# Altium schematic sheet CW341_FPGA_DECOUP.SchDoc: FPGA Decoupling
size Letter; SheetNumber: 2; SheetTotal: 16; SheetApproved: YES; Application_BuildNumber: .
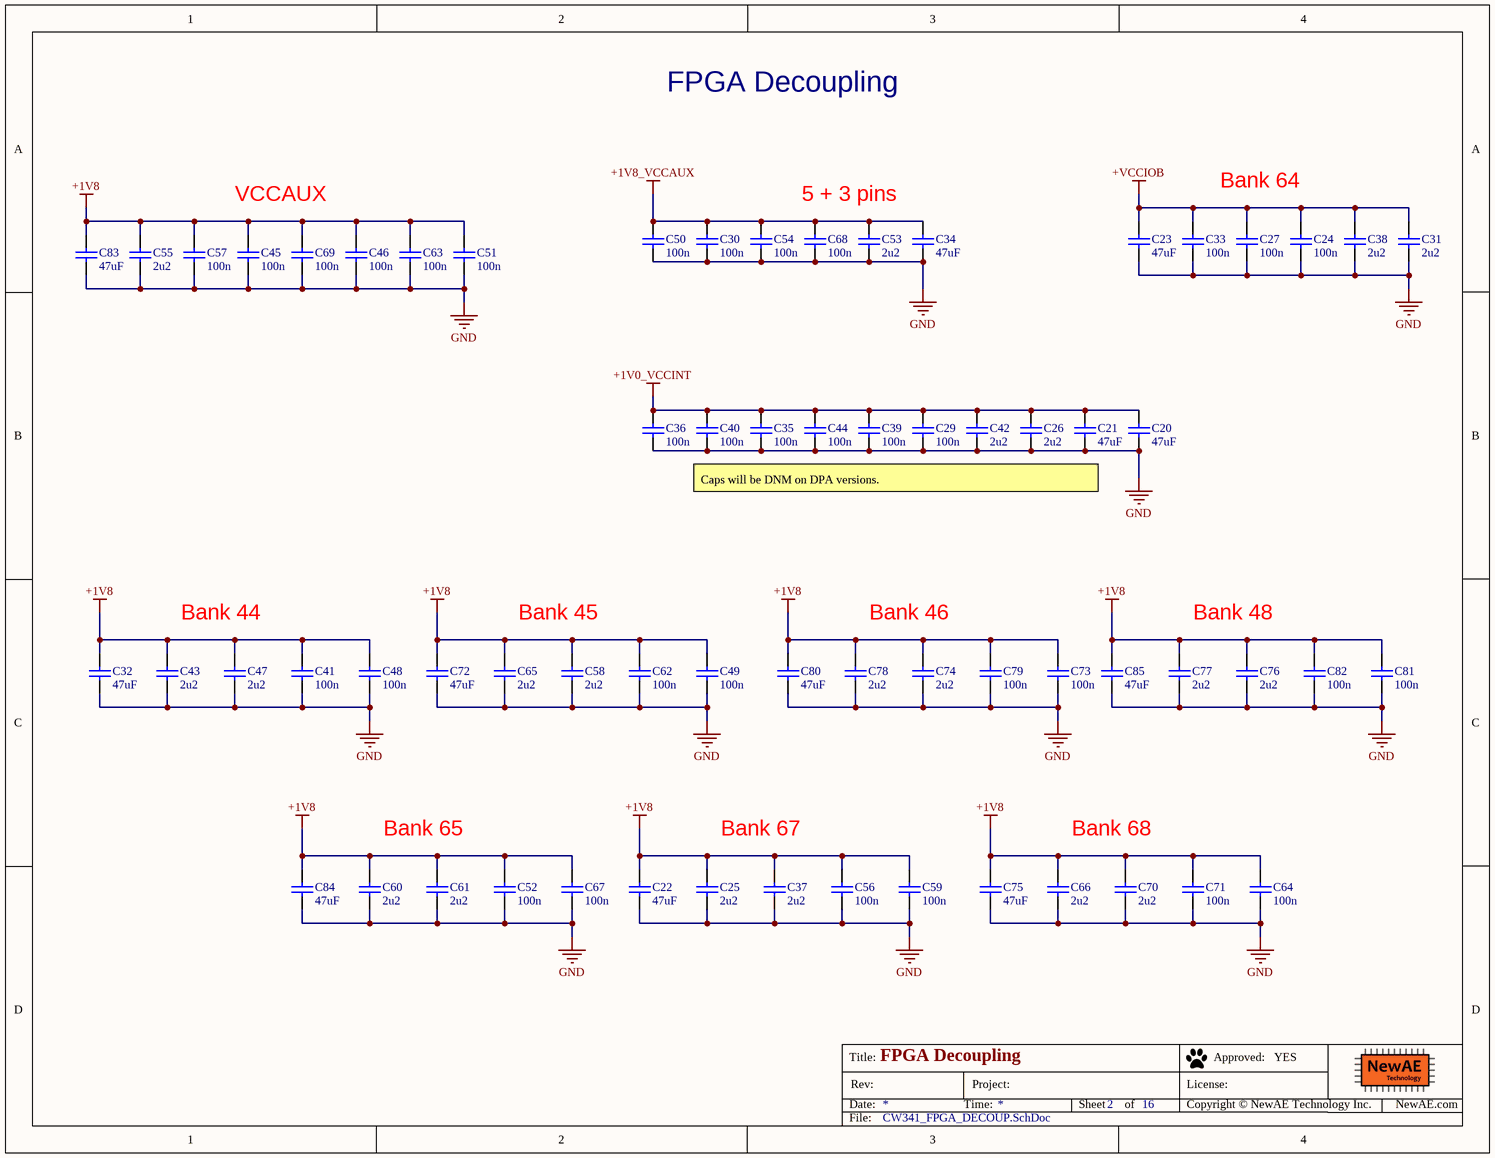
[diagram p0: CW341_FPGA_DECOUP.SchDoc]

## Parts
C20  47uF  [CAPC3225X20N]
C21  47uF  [CAPC3225X20N]
C22  47uF  [CAPC3225X20N]
C23  47uF  [CAPC3225X20N]
C24  100n  [CAPC0402_M]
C25  2u2  [CAPC0603_M]
C26  2u2  [CAPC0603_M]
C27  100n  [CAPC0402_M]
C29  100n  [CAPC0402_M]
C30  100n  [CAPC0402_M]
C31  2u2  [CAPC0603_M]
C32  47uF  [CAPC3225X20N]
C33  100n  [CAPC0402_M]
C34  47uF  [CAPC3225X20N]
C35  100n  [CAPC0402_M]
C36  100n  [CAPC0402_M]
C37  2u2  [CAPC0603_M]
C38  2u2  [CAPC0603_M]
C39  100n  [CAPC0402_M]
C40  100n  [CAPC0402_M]
C41  100n  [CAPC0402_M]
C42  2u2  [CAPC0603_M]
C43  2u2  [CAPC0603_M]
C44  100n  [CAPC0402_M]
C45  100n  [CAPC0402_M]
C46  100n  [CAPC0402_M]
C47  2u2  [CAPC0603_M]
C48  100n  [CAPC0402_M]
C49  100n  [CAPC0402_M]
C50  100n  [CAPC0402_M]
C51  100n  [CAPC0402_M]
C52  100n  [CAPC0402_M]
C53  2u2  [CAPC0603_M]
C54  100n  [CAPC0402_M]
C55  2u2  [CAPC0603_M]
C56  100n  [CAPC0402_M]
C57  100n  [CAPC0402_M]
C58  2u2  [CAPC0603_M]
C59  100n  [CAPC0402_M]
C60  2u2  [CAPC0603_M]
C61  2u2  [CAPC0603_M]
C62  100n  [CAPC0402_M]
C63  100n  [CAPC0402_M]
C64  100n  [CAPC0402_M]
C65  2u2  [CAPC0603_M]
C66  2u2  [CAPC0603_M]
C67  100n  [CAPC0402_M]
C68  100n  [CAPC0402_M]
C69  100n  [CAPC0402_M]
C70  2u2  [CAPC0603_M]
C71  100n  [CAPC0402_M]
C72  47uF  [CAPC3225X20N]
C73  100n  [CAPC0402_M]
C74  2u2  [CAPC0603_M]
C75  47uF  [CAPC3225X20N]
C76  2u2  [CAPC0603_M]
C77  2u2  [CAPC0603_M]
C78  2u2  [CAPC0603_M]
C79  100n  [CAPC0402_M]
C80  47uF  [CAPC3225X20N]
C81  100n  [CAPC0402_M]
C82  100n  [CAPC0402_M]
C83  47uF  [CAPC3225X20N]
C84  47uF  [CAPC3225X20N]
C85  47uF  [CAPC3225X20N]

## Nets
+1V0_VCCINT: C20.1 C21.1 C26.1 C29.1 C35.1 C36.1 C39.1 C40.1 C42.1 C44.1
+1V8: C22.1 C25.1 C32.1 C37.1 C41.1 C43.1 C45.1 C46.1 C47.1 C48.1 C49.1 C51.1 C52.1 C55.1 C56.1 C57.1 C58.1 C59.1 C60.1 C61.1 C62.1 C63.1 C64.1 C65.1 C66.1 C67.1 C69.1 C70.1 C71.1 C72.1 C73.1 C74.1 C75.1 C76.1 C77.1 C78.1 C79.1 C80.1 C81.1 C82.1 C83.1 C84.1 C85.1
+1V8_VCCAUX: C30.1 C34.1 C50.1 C53.1 C54.1 C68.1
+VCCIOB: C23.1 C24.1 C27.1 C31.1 C33.1 C38.1
GND: C20.2 C21.2 C22.2 C23.2 C24.2 C25.2 C26.2 C27.2 C29.2 C30.2 C31.2 C32.2 C33.2 C34.2 C35.2 C36.2 C37.2 C38.2 C39.2 C40.2 C41.2 C42.2 C43.2 C44.2 C45.2 C46.2 C47.2 C48.2 C49.2 C50.2 C51.2 C52.2 C53.2 C54.2 C55.2 C56.2 C57.2 C58.2 C59.2 C60.2 C61.2 C62.2 C63.2 C64.2 C65.2 C66.2 C67.2 C68.2 C69.2 C70.2 C71.2 C72.2 C73.2 C74.2 C75.2 C76.2 C77.2 C78.2 C79.2 C80.2 C81.2 C82.2 C83.2 C84.2 C85.2

## Notes on the sheet
- FPGA Decoupling
- VCCAUX
- 5 + 3 pins
- Bank 64
- Caps will be DNM on DPA versions.
- Bank 44
- Bank 45
- Bank 46
- Bank 48
- Bank 65
- Bank 67
- Bank 68
- Title:
- Date:
- Rev:
- Time:
- Project:
- Sheet
- of
- License:
- Copyright © NewAE Technology Inc.
- Approved:
- NewAE.com
- File:

## Library data of the parts
C20-C23 C32 C34 C72 C75 C80 C83-C85 = CCHIP-47u-1210: 47u, 10V, 1210, Ceramic; Manufacture 1: TDK Corporation; Manufacture Part Number 1: C3225X5R1A476M250AC; Component Group: Capacitor; Case-EIA: 1210; Case-Metric: 3225; Rated Voltage: 10VDC; Tolerance: 20%; Part Number: CCHIP-47u-1210; Footprint: 1210; Pin Count: 2; Supplier 1: Digi-Key; Supplier Part Number 1: 445-6711-1-ND; Value: 47uF; Mounting Technology: SMT; Temperature Range: -55C to 85C; Component Kind: Standard; Component Type: Standard
C24 C27 C29 C30 C33 C35 C36 C39-C41 C44-C46 C48-C52 C54 C56 C57 C59 C62-C64 C67-C69 C71 C73 C79 C81 C82 = CCHIP-100n-0402: 100n, 0402; Manufacture Part Number 1: CGA2B3X7R1V104K050BB; Component Group: Capacitor; Case-EIA: 0402; Part Number: CCHIP-100n-0402; Footprint: 0402; Pin Count: 2; Value: 100n; Mounting Technology: SMT; Component Kind: Standard; Component Type: Standard; Supplier 1: Digi-Key; Supplier Part Number 1: 445-6901-1-ND
C25 C26 C31 C37 C38 C42 C43 C47 C53 C55 C58 C60 C61 C65 C66 C70 C74 C76-C78 = CCHIP-2u2-0603: 2u2, 0603; Manufacture 1: Samsung; Manufacture Part Number 1: CL10B225KP8NNNC; Component Group: Capacitor; Case-EIA: 0603; Case-Metric: 1608; Rated Voltage: 10VDC; Part Number: CCHIP-2u2-0603; Footprint: 0603; Pin Count: 2; Supplier 1: Digi-Key; Supplier Part Number 1: 1276-1134-1-ND; Value: 2u2; Mounting Technology: SMT; Component Kind: Standard; Component Type: Standard